# Altium schematic sheet Interface_Conn1_Carrier_Board.SchDoc: Connector - Carrier J4 DF17 80-pin (Flight I/O)
size A3; ApprovedBy: Weymen Koo; CheckedBy: -; DrawnBy: Weymen Koo; DocumentNumber: UBCAD-FCSOM-SCH; Revision: A; SheetNumber: 17; SheetTotal: 18; ProjectTitle: Flight Controller SoM; Status: PRELIMINARY; ReleaseDate: 2026-11-14
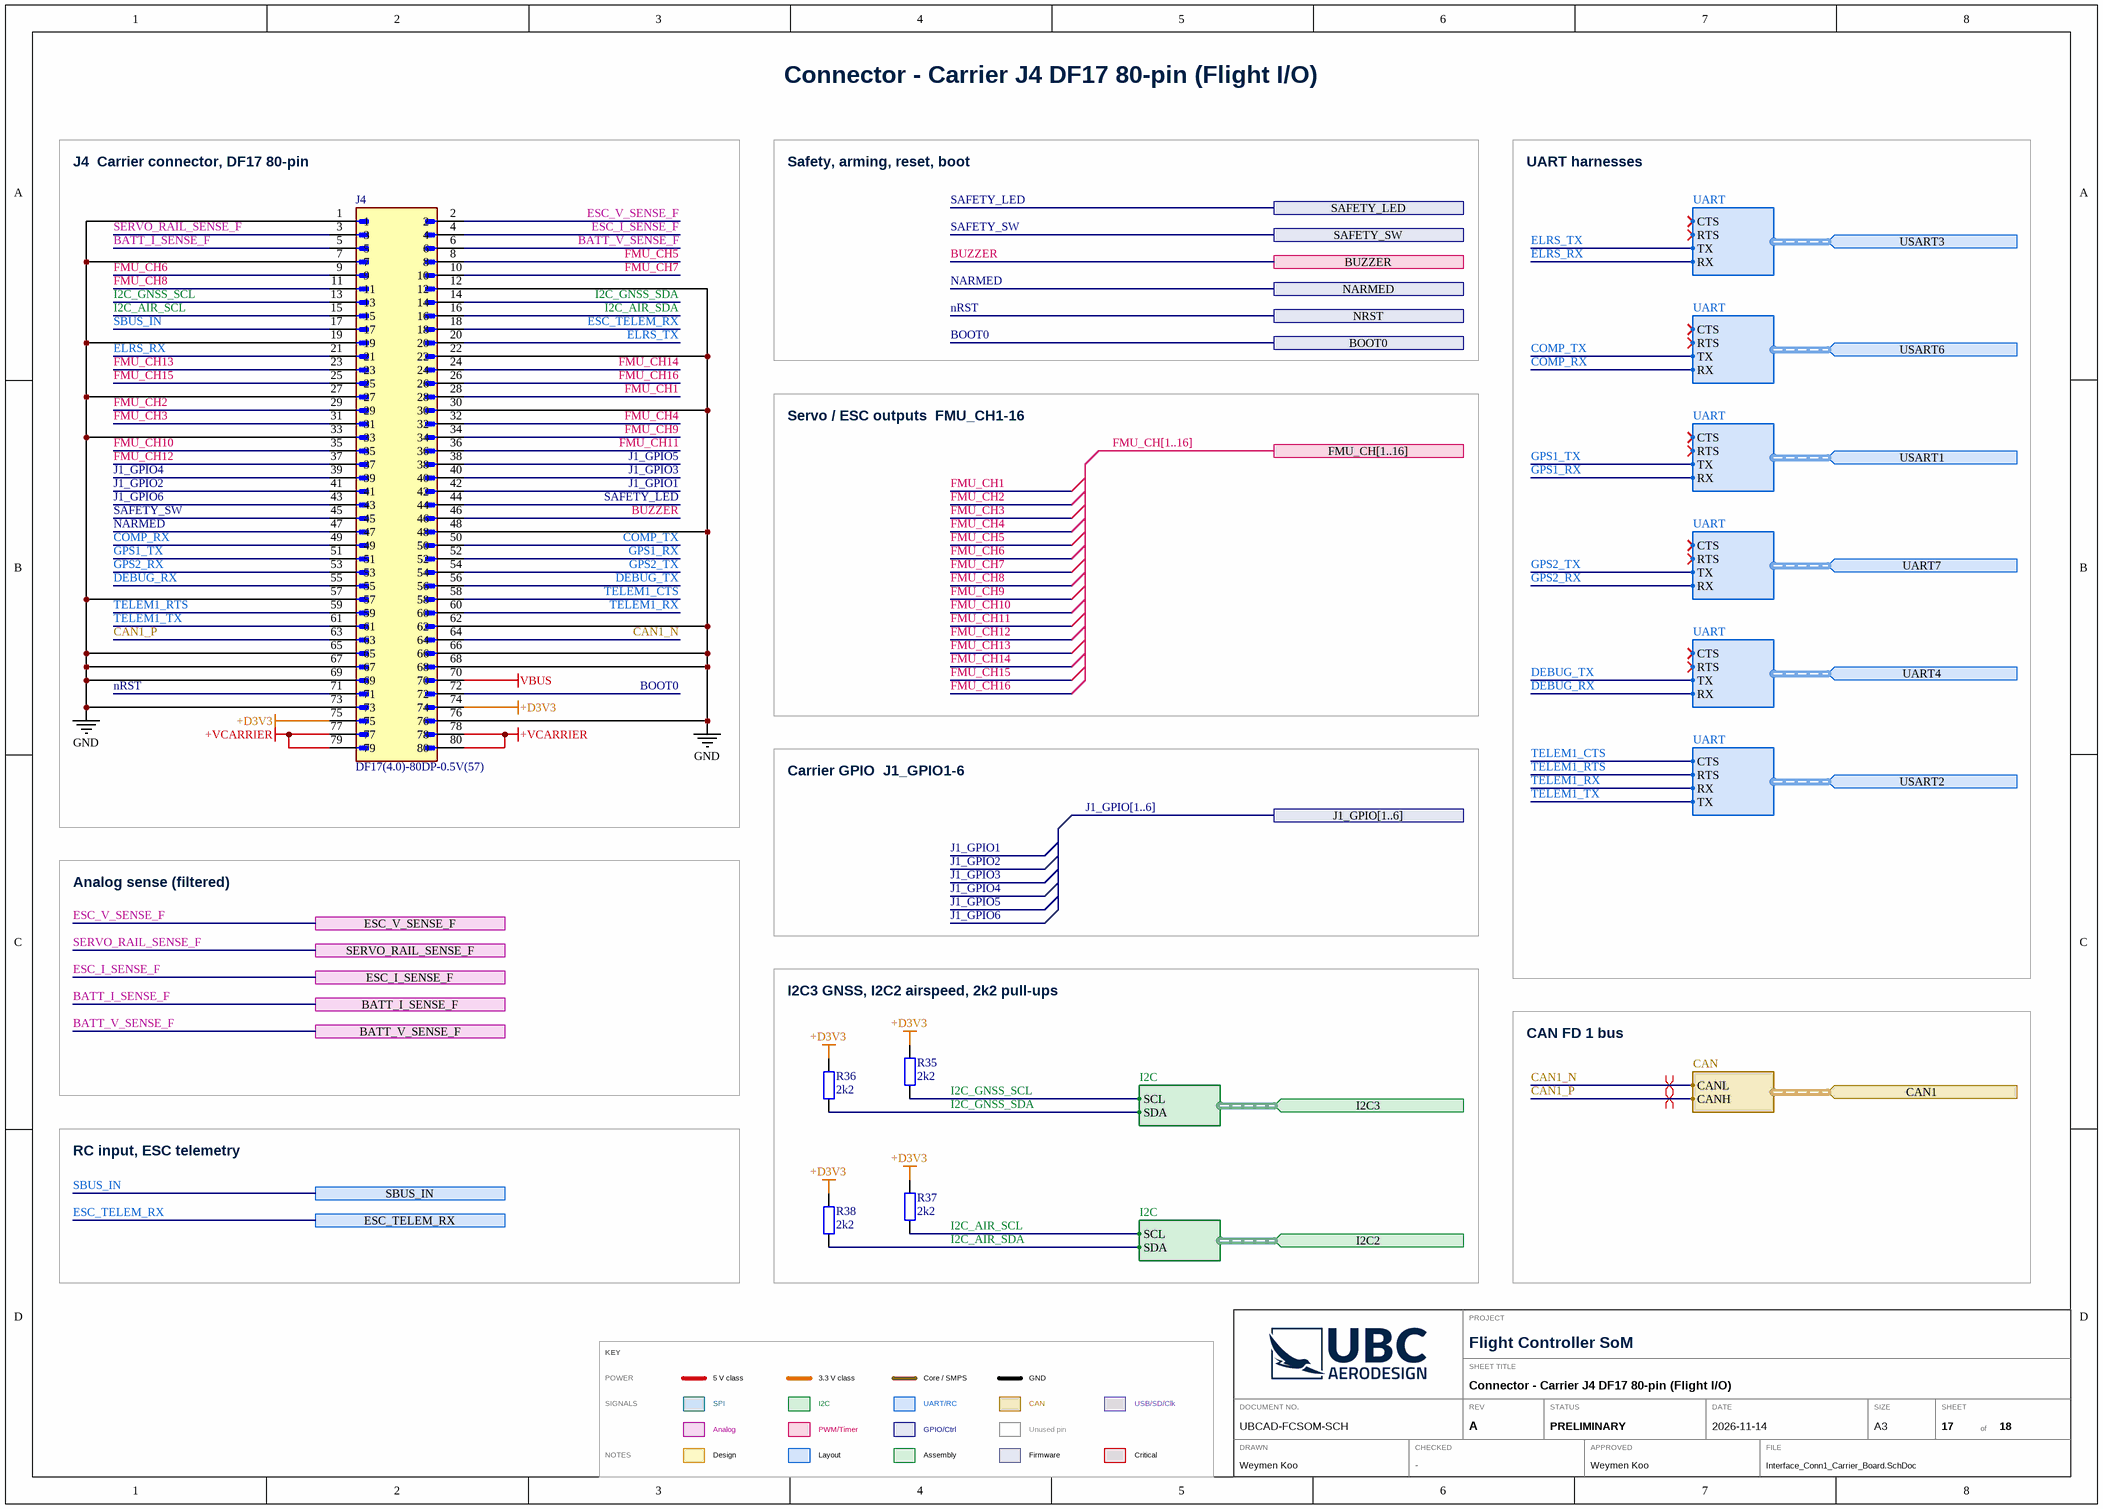
[diagram p0: Interface_Conn1_Carrier_Board.SchDoc]

## Parts
J4  DF17(4.0)-80DP-0.5V(57)  [HRS_DF17(4.0)-80DP-0.5V(57)]
R35  2k2  [IPC C R0402 NO SILK]
R36  2k2  [IPC C R0402 NO SILK]
R37  2k2  [IPC C R0402 NO SILK]
R38  2k2  [IPC C R0402 NO SILK]

## Blocks framed on the sheet
J4  Carrier connector, DF17 80-pin: J4
I2C3 GNSS, I2C2 airspeed, 2k2 pull-ups: R35-R38

## Ports
BATT_I_SENSE_F (see 1[2C], 4[8@]), BATT_V_SENSE_F (see 1[2C], 4[8@]), BOOT0 (see 1[2A], 3[7D]), BUZZER (see 1[2D], 4[9@]), CAN1 (in, harness CAN, see 1[2C], 13[7B]), ESC_I_SENSE_F (see 1[2C], 4[8A]), ESC_TELEM_RX (see 1[2D], 4[9@]), ESC_V_SENSE_F (see 1[2C], 4[8@]), FMU_CH[1..16] (see 1[2C], 4[8A]), I2C2 (in, harness I2C, see 1[2C], 4[4@]), I2C3 (in, harness I2C, see 1[2C], 4[0@]), J1_GPIO[1..6] (see 1[2C], 4[3C]), NARMED (see 1[2D], 4[9@]), NRST (see 1[2A], 3[7C], 15[6C]), SAFETY_LED (see 1[2D], 4[9@]), SAFETY_SW (see 1[2D], 4[9@]), SBUS_IN (see 1[2D], 4[9@]), SERVO_RAIL_SENSE_F (see 1[2D], 4[8@]), UART4 (in, harness UART, see 1[2C], 4[9A]), UART7 (in, harness UART, see 1[2C], 4[9@]), USART1 (in, harness UART, see 1[2C], 4[9A]), USART2 (in, harness UART, see 1[2C], 4[9B]), USART3 (in, harness UART, see 1[2C], 4[9A]), USART6 (in, harness UART, see 1[2C], 4[9B])

## Harnesses
CAN: CANL, CANH
I2C: SCL, SDA
UART: CTS, RTS, RX, TX
UART: CTS, RTS, TX, RX

## Nets
+D3V3: J4.74 J4.75 R35.2 R36.2 R37.2 R38.2
+VCARRIER: J4.77 J4.78 J4.79 J4.80
GND: J4.1 J4.7 J4.12 J4.19 J4.22 J4.27 J4.30 J4.33 J4.48 J4.57 J4.62 J4.65 J4.66 J4.67 J4.68 J4.69 J4.73 J4.76
VBUS: J4.70
BATT_I_SENSE_F: J4.5 ; port BATT_I_SENSE_F
BATT_V_SENSE_F: J4.6 ; port BATT_V_SENSE_F
BOOT0: J4.72 ; port BOOT0
BUZZER: J4.46 ; port BUZZER
CAN1_N: J4.64 ; port CAN1.CANL
CAN1_P: J4.63 ; port CAN1.CANH
COMP_RX: J4.49 ; port USART6.RX
COMP_TX: J4.50 ; port USART6.TX
DEBUG_RX: J4.55 ; port UART4.RX
DEBUG_TX: J4.56 ; port UART4.TX
ELRS_RX: J4.21 ; port USART3.RX
ELRS_TX: J4.20 ; port USART3.TX
ESC_I_SENSE_F: J4.4 ; port ESC_I_SENSE_F
ESC_TELEM_RX: J4.18 ; port ESC_TELEM_RX
ESC_V_SENSE_F: J4.2 ; port ESC_V_SENSE_F
FMU_CH1: J4.28
FMU_CH2: J4.29
FMU_CH3: J4.31
FMU_CH4: J4.32
FMU_CH5: J4.8
FMU_CH6: J4.9
FMU_CH7: J4.10
FMU_CH8: J4.11
FMU_CH9: J4.34
FMU_CH10: J4.35
FMU_CH11: J4.36
FMU_CH12: J4.37
FMU_CH13: J4.23
FMU_CH14: J4.24
FMU_CH15: J4.25
FMU_CH16: J4.26
GPS1_RX: J4.52 ; port USART1.RX
GPS1_TX: J4.51 ; port USART1.TX
GPS2_RX: J4.53 ; port UART7.RX
GPS2_TX: J4.54 ; port UART7.TX
I2C_AIR_SCL: J4.15 R37.1 ; port I2C2.SCL
I2C_AIR_SDA: J4.16 R38.1 ; port I2C2.SDA
I2C_GNSS_SCL: J4.13 R35.1 ; port I2C3.SCL
I2C_GNSS_SDA: J4.14 R36.1 ; port I2C3.SDA
J1_GPIO1: J4.42
J1_GPIO2: J4.41
J1_GPIO3: J4.40
J1_GPIO4: J4.39
J1_GPIO5: J4.38
J1_GPIO6: J4.43
NARMED: J4.47 ; port NARMED
nRST: J4.71 ; port NRST
SAFETY_LED: J4.44 ; port SAFETY_LED
SAFETY_SW: J4.45 ; port SAFETY_SW
SBUS_IN: J4.17 ; port SBUS_IN
SERVO_RAIL_SENSE_F: J4.3 ; port SERVO_RAIL_SENSE_F
TELEM1_CTS: J4.58 ; port USART2.CTS
TELEM1_RTS: J4.59 ; port USART2.RTS
TELEM1_RX: J4.60 ; port USART2.RX
TELEM1_TX: J4.61 ; port USART2.TX

## Buses and harness runs
bus FMU_CH[1..16] = port FMU_CH[1..16]
bus J1_GPIO[1..6] = port J1_GPIO[1..6]

## Layout directives
differential pair: CAN1_N, CAN1_P

## Notes on the sheet
- Safety, arming, reset, boot
- UART harnesses
- Servo / ESC outputs  FMU_CH1-16
- Carrier GPIO  J1_GPIO1-6
- Analog sense (filtered)
- CAN FD 1 bus
- RC input, ESC telemetry
- PROJECT
- KEY
- POWER
- 5 V class
- 3.3 V class
- Core / SMPS
- GND
- SHEET TITLE
- SIGNALS
- NOTES
- SPI
- Analog
- Design
- I2C
- PWM/Timer
- Layout
- UART/RC
- GPIO/Ctrl
- Assembly
- CAN
- Unused pin
- Firmware
- USB/SD/Clk
- Critical
- DRAWN
- DOCUMENT NO.
- CHECKED
- REV
- STATUS
- APPROVED
- DATE
- FILE
- SIZE
- A3
- SHEET
- of

## Library data of the parts
J4 = CMP-003-000029-3: Board-To-Board Connector, DF17 Series, Surface Mount, Header, 80, 0.5 mm, Gold Plated Contacts; MF: Hirose Electric; MP: DF17(4.0)-80DP-0.5V(57); Source: DF17(4.0)-80DP-0.5V(57).SchLib; SnapEDA_Link: https://www.snapeda.com/parts/DF17(4.0)-80DP-0.5V(57)/Hirose/view-part/?ref=snap; Design Item ID: DF17(4.0)-80DP-0.5V(57); Check_prices: https://www.snapeda.com/parts/DF17(4.0)-80DP-0.5V(57)/Hirose/view-part/?ref=eda; Package: None; Component Type: Standard; Pin Count: 80; Value: *
R35-R38 = CMP-008-000000-2: RES 2k2 1% 1/16W 0402; Manufacturer: UNI-ROYAL; Manufacturer Part Number: 0402WGF2201TCE; Value: 2k2; Source: Schlib1.SchLib; Design Item ID: Generic RES 0402; Package: 0402; Tolerance: 1%; Power: 1/16W; LCSC Part #: C25879